# Altium schematic sheet LiFePo_Charging_Section.SchDoc
size A; DocumentNumber: 4; SheetNumber: 4; SheetTotal: 13
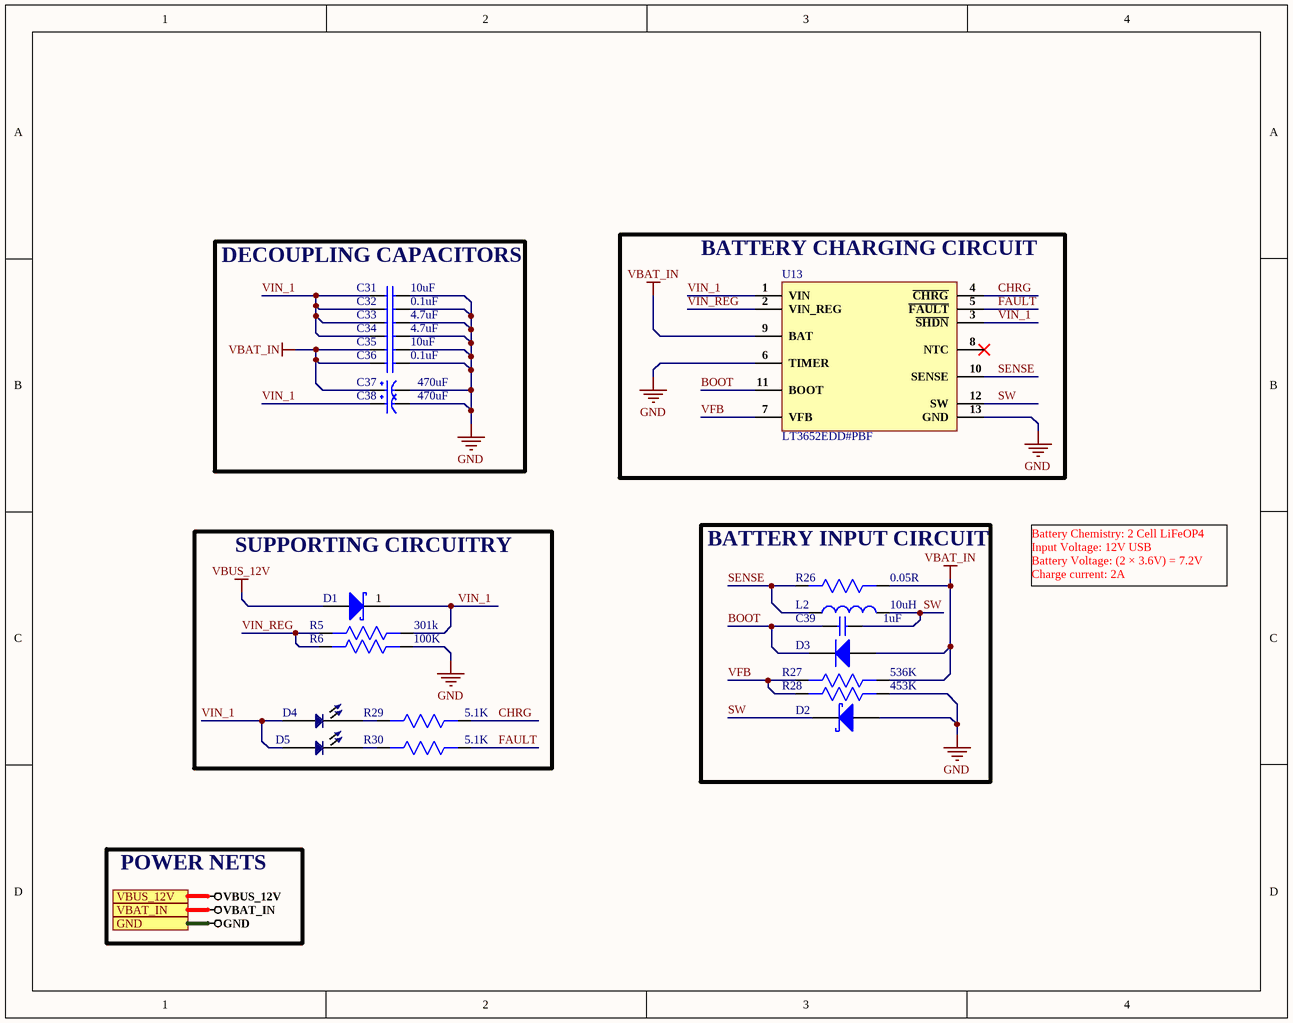
[diagram p0: LiFePo_Charging_Section.SchDoc]

## Parts
C31  10uF  [CAP-0603]
C32  0.1uF  [CAP-0603]
C33  4.7uF  [CAP-0603]
C34  4.7uF  [CAP-0603]
C35  10uF  [CAP-0603]
C36  0.1uF  [CAP-0603]
C37  470uF  [UCD1E471MNL1GS]
C38  470uF  [UCD1E471MNL1GS]
C39  1uF  [CAP-0603]
D1  CMSH3-40MA TR13 PBFREE  [DO-214AC]  (value not drawn)
D2  CMSH3-40MA TR13 PBFREE  [DO-214AC]  (value not drawn)
D3  S1A-13-F  [SMA]  (value not drawn)
D4  XZVG68W-2  [LED 0402]  (value not drawn)
D5  XZVG68W-2  [LED 0402]  (value not drawn)
L2  10uH  [SLF10145T-100M2R5-PF]
R5  301k  [RES-0603]
R6  100K  [RES-0603]
R26  0.05R  [RES 2010]
R27  536K  [RES-0603]
R28  453K  [RES-0603]
R29  5.1K  [RES-0603]
R30  5.1K  [RES-0603]
U13  LT3652EDD#PBF  [LT3652EDD#PBF]

## Blocks framed on the sheet
DECOUPLING CAPACITORS: C31-C38
BATTERY CHARGING CIRCUIT: U13
SUPPORTING CIRCUITRY: D1 D4 D5 R5 R6 R29 R30
BATTERY INPUT CIRCUIT: C39 D2 D3 L2 R26-R28

## Ports
GND, VBAT_IN, VBUS_12V

## Nets
GND: C31.2 C32.2 C33.2 C34.2 C35.2 C36.2 C37.2 C38.2 D2.2 R6.1 R28.1 U13.6(TIMER) U13.13(GND) ; port GND
VBAT_IN: C35.1 C36.1 C37.1 D3.2 R26.1 R27.1 U13.9(BAT) ; port VBAT_IN
VBUS_12V: D1.2 ; port VBUS_12V
BOOT: C39.1 D3.1 U13.11(BOOT)
CHRG: R29.1 U13.4(~{CHRG})
FAULT: R30.1 U13.5(~{FAULT})
SENSE: L2.1 R26.2 U13.10(SENSE)
SW: C39.2 D2.1 L2.2 U13.12(SW)
VFB: R27.2 R28.2 U13.7(VFB)
VIN_1: C31.1 C32.1 C33.1 C34.1 C38.1 D1.1 D4.1 D5.1 R5.1 U13.1(VIN) U13.3(~{SHDN})
VIN_REG: R5.2 R6.2 U13.2(VIN_REG)
NetD4_2: D4.2 R29.2
NetD5_2: D5.2 R30.2

Not connected (* = marked no-connect by the designer): U13 8(NTC)*

## Notes on the sheet
- Battery Chemistry: 2 Cell LiFeOP4
  Input Voltage: 12V USB
  Battery Voltage: (2 × 3.6V) = 7.2V
  Charge current: 2A
- POWER NETS

## Library data of the parts
C31 C35 = TMK107BBJ106MA-T: CAP CER 10UF 25V X5R 0603; Manufacturer: Taiyo Yuden; Tolerance: 20%; Supplier 1: Digi-Key; Manufacturer Part Number: TMK107BBJ106MA-T; Stock 1: 85333; Pricing 1: 1=0.46, 10=0.32, 50=0.2238, 100=0.1918, 500=0.14386, 1000=0.12149 (USD); Mount: Surface Mount; Case/Package: 0603; Case Code (Imperial): 0603; Case Code (Metric): 1608; Min Operating Temperature: -55°C; Max Operating Temperature: 85°C; Packaging: Tape and Reel; Capacitance: 10uF; Voltage Rating: 25V; Lead Free: Lead Free; RoHS Compliant: Yes; ComponentLink1URL: http://ds.yuden.co.jp/TYCOMPAS/ut/detail.do?productNo=TMK107BBJ106MA-T&fileName=TMK107BBJ106MA-T_SS&mode=specSheetDownload&src-supplier=Digi-Key; ComponentLink1Description: http://ds.yuden.co.jp/TYCOMPAS/ut/detail.do?productNo=TMK107BBJ106MA-T&fileName=TMK107BBJ106MA-T_SS&mode=specSheetDownload&src-supplier=Digi-Key; Supplier Part Number 1: 587-6023-1-ND
C32 C36 = CL10B104KB8NNNL: CAP CER 0.1UF 50V X7R 0603; Manufacturer: Samsung; Capacitance: 100nF; Tolerance: 10%; Supplier 1: Digi-Key; Manufacturer Part Number: CL10B104KB8NNNL; Stock 1: 3731229; Pricing 1: 1=0.1, 10=0.03, 50=0.0164, 100=0.0134, 500=0.00958, 1000=0.00753, 2500=0.00684, 5000=0.0063 (USD); Mount: Surface Mount; Case/Package: 0603; Min Operating Temperature: -55°C; Max Operating Temperature: 125°C; Dielectric: X7R; Packaging: Tape and Reel; Package Quantity: 15000; Voltage Rating: 50V; Voltage Rating (DC): 50V; Series: CL; Construction: Flat; Length: 1.6mm; Width: 0.031inch; Height: 0.8mm; Thickness: 0.035inch; Depth: 0.8mm; Radiation Hardening: No; RoHS Compliant: Yes; ComponentLink1URL: https://www.verical.com/server-webapp/html/getDatasheet?partID=357523&src-supplier=Verical; ComponentLink1Description: https://www.verical.com/server-webapp/html/getDatasheet?partID=357523&src-supplier=Verical; ComponentLink2URL: https://media.digikey.com/pdf/Data%20Sheets/Samsung%20PDFs/CL_Series_MLCC_ds.pdf?src-supplier=Digi-Key; ComponentLink2Description: https://media.digikey.com/pdf/Data%20Sheets/Samsung%20PDFs/CL_Series_MLCC_ds.pdf?src-supplier=Digi-Key; Supplier Part Number 1: 1276-CL10B104KB8NNNLCT-ND
C33 C34 = CL10A475KA8NQNC: CAP CER 4.7UF 25V X5R 0603; Manufacturer: Samsung; Tolerance: 10%; Supplier 1: Digi-Key; Manufacturer Part Number: CL10A475KA8NQNC; Stock 1: 345169; Pricing 1: 1=0.37, 10=0.255, 50=0.1784, 100=0.1528, 500=0.11462, 1000=0.0968 (USD); Mount: Surface Mount; Case/Package: 0603; Case Code (Metric): 1608; Case Code (Imperial): 0603; Contact Plating: Tin; Min Operating Temperature: -55°C; Max Operating Temperature: 85°C; Package Quantity: 1; Packaging: Tape and Reel; Capacitance: 4.7uF; Voltage Rating: 25V; Dielectric: X5R; Series: CL; Termination: Wraparound; Construction: Flat; Length: 1.6mm; Width: 0.031inch; Thickness: 0.035inch; Depth: 0.8mm; Lead Free: Lead Free; RoHS Compliant: Yes; ComponentLink1URL: http://www.samsungsem.com/kr/support/product-search/mlcc/CL10A475KA8NQNC.jsp?src-supplier=Digi-Key; ComponentLink1Description: http://www.samsungsem.com/kr/support/product-search/mlcc/CL10A475KA8NQNC.jsp?src-supplier=Digi-Key; Supplier Part Number 1: 1276-1900-6-ND
C37 C38 = UCD1E471MNL1GS: CAP ALUM 470UF 20% 25V SMD; Manufacturer: Nichicon; Ripple Current: 850mA; Impedance: 80mR; Leakage Current: 3uA; Life (Hours): 5000Hour; Dissipation Factor: 0.14%; Supplier 1: Digi-Key; Manufacturer Part Number: UCD1E471MNL1GS; Stock 1: 0; Pricing 1: 1=0.96, 10=0.708, 50=0.566, 100=0.4852 (USD); Mount: Surface Mount,PCB; Case/Package: Radial; Min Operating Temperature: -55°C; Max Operating Temperature: 105°C; Capacitance: 470uF; Tolerance: 20%; Package Quantity: 1; Packaging: Tape and Reel; Voltage Rating: 25V; Voltage Rating (DC): 25V; Termination: SMD/SMT; Voltage: 25V; Features: General Purpose; Series: CD; Construction: Cylindrical; Diameter: 10mm; Length: 10mm; Height: 10mm; Height - Seated (Max): 0.394inch; Radiation Hardening: No; RoHS Compliant: Yes; ComponentLink1URL: http://nichicon-us.com/english/products/pdfs/e-ucd.pdf?src-supplier=Digi-Key; ComponentLink1Description: http://nichicon-us.com/english/products/pdfs/e-ucd.pdf?src-supplier=Digi-Key; ComponentLink2URL: http://www.mouser.com/ds/2/293/e-cd-22158.pdf?src-supplier=Mouser; ComponentLink2Description: http://www.mouser.com/ds/2/293/e-cd-22158.pdf?src-supplier=Mouser; ComponentLink3URL: http://uk.rs-online.com/webdocs/0ebd/0900766b80ebdadd.pdf?src-supplier=RSComponents; ComponentLink3Description: http://uk.rs-online.com/webdocs/0ebd/0900766b80ebdadd.pdf?src-supplier=RSComponents; ComponentLink4URL: http://www.nichicon.co.jp/english/products/pdfs/e-cd.pdf?src-supplier=Avnet; ComponentLink4Description: http://www.nichicon.co.jp/english/products/pdfs/e-cd.pdf?src-supplier=Avnet; ComponentLink5URL: http://products.nichicon.co.jp/en/pdf/XJA043/e-cd.pdf?src-supplier=Future+Electronics; ComponentLink5Description: http://products.nichicon.co.jp/en/pdf/XJA043/e-cd.pdf?src-supplier=Future+Electronics; ComponentLink6URL: https://www.verical.com/server-webapp/html/getDatasheet?partID=512790&src-supplier=Verical; ComponentLink6Description: https://www.verical.com/server-webapp/html/getDatasheet?partID=512790&src-supplier=Verical; ComponentLink7URL: http://www.nichicon.co.jp/english/products/pdfs/e-cd.pdf?src-supplier=Avnet+Europe; ComponentLink7Description: http://www.nichicon.co.jp/english/products/pdfs/e-cd.pdf?src-supplier=Avnet+Europe; Supplier Part Number 1: 493-6386-1-ND
C39 = CL10A105KA8NNNC: CAP CER 1UF 25V X5R 0603; Manufacturer: Sams; Tolerance: 10%; Supplier 1: Digi-Key; Manufacturer Part Number: CL10A105KA8NNNC; Stock 1: 2768758; Pricing 1: 1=0.1, 10=0.036, 50=0.0198, 100=0.0161, 500=0.01152, 1000=0.00904 (USD); Mount: Surface Mount; Case/Package: 0603; Min Operating Temperature: -55°C; Max Operating Temperature: 85°C; Capacitance: 1uF; Dielectric: X5R; Voltage Rating (DC): 25V; Voltage: 25V; Length: 1.6mm; Height: 0.8mm; Depth: 0.8mm; Lead Free: Lead Free; Supplier Part Number 1: 1276-1102-1-ND
D1 D2 = CMSH3-40MA TR13 PBFREE: DIODE SCHOTTKY 40V 3A SMA; Manufacturer: Central Semiconductor; Supplier 1: Digi-Key; Manufacturer Part Number: CMSH3-40MA TR13 PBFREE; Stock 1: 27620; Pricing 1: 1=0.67, 10=0.592, 100=0.4536, 500=0.3586, 1000=0.28688, 2000=0.25999 (USD); RoHS Compliant: Yes; Supplier Part Number 1: 1514-CMSH3-40MATR13PBFREEDKR-ND
D3 = S1A-13-F: Diode Switching 50V 1A 2-Pin SMA T/R; Manufacturer: Diodes; Element Configuration: Single; Reverse Recovery Time: 3us; Peak Non-Repetitive Surge Current: 30A; Max Reverse Current: 5uA; Forward Voltage: 1.1V; Recovery Time: 1.8us; Polarity: Standard; Capacitance: 10pF; ComponentLink1URL: http://www.mouser.com/ds/2/115/ds16008-60440.pdf?src-supplier=Mouser; ComponentLink1Description: http://www.mouser.com/ds/2/115/ds16008-60440.pdf?src-supplier=Mouser; ComponentLink2URL: http://www.diodes.com///datasheets/ds16008.pdf?src-supplier=Avnet; ComponentLink2Description: http://www.diodes.com///datasheets/ds16008.pdf?src-supplier=Avnet; ComponentLink3URL: http://www.te.com/commerce/DocumentDelivery/DDEController?Action=showdoc&DocId=Data+Sheet%7FRPII%2F2%7F0415%7Fpdf%7FEnglish%7FENG_DS_RPIIX2_0415.pdf&src-supplier=Digi-Key; ComponentLink3Description: http://www.te.com/commerce/DocumentDelivery/DDEController?Action=showdoc&DocId=Data+Sheet%7FRPII%2F2%7F0415%7Fpdf%7FEnglish%7FENG_DS_RPIIX2_0415.pdf&src-supplier=Digi-Key; ComponentLink4URL: https://www.diodes.com/assets/Datasheets/ds16008.pdf?src-supplier=Digi-Key; ComponentLink4Description: https://www.diodes.com/assets/Datasheets/ds16008.pdf?src-supplier=Digi-Key; Supplier 1: Digi-Key; Manufacturer Part Number: S1A-13-F; RoHS: Yes; Category: Rectifier Diodes; Stock 1: 647079; Pricing 1: 1=0.26000, 10=0.21300, 100=0.11290, 500=0.07424, 1000=0.05049, 2000=0.04554 (USD); Mount: Surface Mount; Case/Package: SMA; Number of Pins: 2; Weight: 0.002258oz; Min Operating Temperature: -65°C; Max Operating Temperature: 150°C; Forward Current: 1A; Max Repetitive Reverse Voltage (Vrrm): 50V; Packaging: Tape and Reel; Package Quantity: 5000; Max Surge Current: 30A; Reverse Voltage (DC): 50V; Average Rectified Current: 1A; Voltage Rating (DC): 50V; Current Rating: 1A; Output Current: 1A; Max Reverse Voltage (DC): 50V; Max Forward Surge Current (Ifsm): 30A; Termination: SMD/SMT; Series: -; Length: 4.6mm; Width: 2.92mm; Height: 2.1mm; Radiation Hardening: No; Lead Free: Lead Free; REACH SVHC: No SVHC; RoHS Compliant: Yes; ComponentLink5URL: https://datasheet.ciiva.com/911/ds16003-911872.pdf?src-supplier=Digi-Key; ComponentLink5Description: https://datasheet.ciiva.com/911/ds16003-911872.pdf?src-supplier=Digi-Key; ComponentLink6URL: https://datasheet.ciiva.com/27052/1541520-27052419.pdf?src-supplier=Jameco; ComponentLink6Description: https://datasheet.ciiva.com/27052/1541520-27052419.pdf?src-supplier=Jameco; ComponentLink7URL: https://datasheet.ciiva.com/22695/1911706-22695830.pdf?src-supplier=Element14; ComponentLink7Description: https://datasheet.ciiva.com/22695/1911706-22695830.pdf?src-supplier=Element14; ComponentLink8URL: https://datasheet.ciiva.com/16199/ds16003-16199336.pdf?src-supplier=Future+Electronics; ComponentLink8Description: https://datasheet.ciiva.com/16199/ds16003-16199336.pdf?src-supplier=Future+Electronics; ComponentLink9URL: https://datasheet.ciiva.com/4453/ds16003-83672-4453580.pdf?src-supplier=Mouser; ComponentLink9Description: https://datasheet.ciiva.com/4453/ds16003-83672-4453580.pdf?src-supplier=Mouser; ComponentLink10URL: https://datasheet.ciiva.com/25953/ds16003-25953033.pdf?src-supplier=Avnet+Europe; ComponentLink10Description: https://datasheet.ciiva.com/25953/ds16003-25953033.pdf?src-supplier=Avnet+Europe; ComponentLink11URL: https://datasheet.ciiva.com/8301/ds16003-8301429.pdf?src-supplier=Avnet; ComponentLink11Description: https://datasheet.ciiva.com/8301/ds16003-8301429.pdf?src-supplier=Avnet; Supplier Part Number 1: S1A-FDICT-ND
D4 D5 = XZVG68W-2: LED GREEN CLEAR CHIP SMD; Manufacturer: SunLED; Lens Color: Colorless; Luminous Intensity: 49mcd; Test Current: 20mA; Viewing Angle: 120°; Dominant Wavelength: 570nm; Forward Voltage: 2.1V; Supplier 1: Digi-Key; Manufacturer Part Number: XZVG68W-2; Stock 1: 122154; Pricing 1: 1=0.37, 10=0.293, 100=0.1314, 500=0.11872, 1000=0.09752 (USD); Mount: Surface Mount; Case/Package: 0402; Color: Green; Case Code (Metric): 1005; Case Code (Imperial): 0402; Packaging: Tape and Reel; Lens Transparency: Clear; Length: 1mm; Width: 0.5mm; Height: 0.6mm; RoHS Compliant: Yes; ComponentLink1URL: https://www.sunledusa.com/products/spec/XZVG68W-2.pdf?src-supplier=Digi-Key; ComponentLink1Description: https://www.sunledusa.com/products/spec/XZVG68W-2.pdf?src-supplier=Digi-Key; ComponentLink2URL: http://www.sunledusa.com/products/spec/XZVG68W-2.pdf?src-supplier=Digi-Key; ComponentLink2Description: http://www.sunledusa.com/products/spec/XZVG68W-2.pdf?src-supplier=Digi-Key; Supplier Part Number 1: 1497-1219-6-ND
L2 = SLF10145T-100M2R5-PF: FIXED IND 10UH 2.5A 43.7 MOHM; Manufacturer: TDK; Core Material: Ferrite; Tolerance: 20%; Saturation Current: 3A; Shielding: Shielded; DC Resistance (DCR): 36.4mR; Test Frequency: 1kHz; Supplier 1: Digi-Key; Manufacturer Part Number: SLF10145T-100M2R5-PF; Stock 1: 3269; Pricing 1: 1=1.05, 10=0.975, 25=0.9, 50=0.75, 100=0.705, 250=0.63 (USD); Mount: Surface Mount; Case/Package: Nonstandard; Number of Pins: 2; Min Operating Temperature: -40°C; Max Operating Temperature: 105°C; Inductance: 10uH; Max DC Current: 2.5A; Package Quantity: 500; Current Rating: 2.5A; Packaging: Tape and Reel; Inductance Tolerance: 20%; Resistor Type: Wirewound; Termination: SMD/SMT; DC Current: 2.5A; RMS Current (Irms): 3A; Series: SLF; Rated Current-Max: 3A; Length: 10.1mm; Width: 0.398inch; Height: 4.5mm; Height - Seated (Max): 0.189inch; Depth: 10.4mm; Radiation Hardening: No; REACH SVHC: No SVHC; Military Standard: Not; Lead Free: Lead Free; RoHS Compliant: Yes; ComponentLink1URL: http://www.farnell.com/datasheets/1838969.pdf?src-supplier=Element14; ComponentLink1Description: http://www.farnell.com/datasheets/1838969.pdf?src-supplier=Element14; ComponentLink2URL: http://uk.rs-online.com/webdocs/14e9/0900766b814e91a9.pdf?src-supplier=RSComponents; ComponentLink2Description: http://uk.rs-online.com/webdocs/14e9/0900766b814e91a9.pdf?src-supplier=RSComponents; ComponentLink3URL: http://components.arrow.com/part/dataview/42010891S8914805N1165?src-supplier=Arrow+Electronics; ComponentLink3Description: http://components.arrow.com/part/dataview/42010891S8914805N1165?src-supplier=Arrow+Electronics; ComponentLink4URL: http://datasheet.iiic.cc/tdk/SLF10145T-100M2R5-PF.pdf?src-supplier=IIIC; ComponentLink4Description: http://datasheet.iiic.cc/tdk/SLF10145T-100M2R5-PF.pdf?src-supplier=IIIC; Supplier Part Number 1: 445-1975-6-ND
R5 = CRCW0603301KFKEB: RES SMD 301K OHM 1% 1/10W 0603; Manufacturer: Vishay Dale; Resistance: 301kR; Power Rating: 100mW; Voltage Rating: 75V; Temperature Coefficient: 100ppm/°C; Supplier 1: Digi-Key; Manufacturer Part Number: CRCW0603301KFKEB; Stock 1: 17460; Pricing 1: 1=0.1, 10=0.036, 100=0.0145, 1000=0.00652, 2500=0.00566, 5000=0.00468 (USD); Case/Package: 0603; Weight: 7.1E-05oz; Case Code (Imperial): 0603; Case Code (Metric): 1608; Min Operating Temperature: -55°C; Max Operating Temperature: 155°C; Tolerance: 1%; Packaging: Tape and Reel; Package Quantity: 10000; Resistor Type: Thick Film; Termination: SMD/SMT; Number of Terminations: 2; Max Power Dissipation: 100mW; Features: Automotive AEC-Q200; Series: CRCW; Construction: Rectangular; Length: 1.55mm; Width: 0.85mm; Height: 0.02inch; Depth: 0.85mm; Military Standard: Not; Lead Free: Lead Free; RoHS Compliant: Yes; ComponentLink1URL: http://www.mouser.com/ds/2/427/dcrcwe3-109170.pdf?src-supplier=Mouser; ComponentLink1Description: http://www.mouser.com/ds/2/427/dcrcwe3-109170.pdf?src-supplier=Mouser; ComponentLink2URL: http://components.arrow.com/part/dataview/0323_06076993?src-supplier=Arrow+Europe; ComponentLink2Description: http://components.arrow.com/part/dataview/0323_06076993?src-supplier=Arrow+Europe; ComponentLink3URL: http://www.vishay.com/docs/20035/dcrcwe3.pdf?src-supplier=Digi-Key; ComponentLink3Description: http://www.vishay.com/docs/20035/dcrcwe3.pdf?src-supplier=Digi-Key; Supplier Part Number 1: 541-CRCW0603301KFKEBDKR-ND
R6 = CRGH0603J100K: RES SMD 100K OHM 5% 1/5W 0603; Manufacturer: TE Connectivity; Resistance: 100kR; Temperature Coefficient: 100ppm/°C; Power Rating: 200mW; Voltage Rating: 50V; Number of Resistors: 1; Supplier 1: Digi-Key; Manufacturer Part Number: CRGH0603J100K; Stock 1: 23277; Pricing 1: 1=0.1, 10=0.049, 100=0.02, 1000=0.00899, 2500=0.0078 (USD); Mount: Surface Mount; Case/Package: 0603; Case Code (Imperial): 0603; Case Code (Metric): 1608; Min Operating Temperature: -55°C; Max Operating Temperature: 125°C; Tolerance: 5%; Packaging: Tape and Reel; Resistor Type: Thick Film,Power resistor; Number of Terminations: 2; Series: CRGH; Termination: Solder; Voltage Rating (DC): 50V; Resistance Tolerance: 5%; Technology: THICK FILM; Length: 1.6mm; Width: 0.8mm; Height: 0.45mm; Depth: 0.8mm; RoHS Compliant: Yes; REACH SVHC: No SVHC; ELV: Compliant; ComponentLink1URL: http://www.farnell.com/datasheets/2007183.pdf?src-supplier=Element14; ComponentLink1Description: http://www.farnell.com/datasheets/2007183.pdf?src-supplier=Element14; Supplier Part Number 1: A126393DKR-ND
R26 = WSL2010R0500FEA: RES 0.05 OHM 1% 1/2W 2010; Manufacturer: Vishay Dale; Temperature Coefficient: 75ppm/°C; Resistance: 50mR; Power Rating: 500mW; Voltage Rating: 150mV; Supplier 1: Digi-Key; Manufacturer Part Number: WSL2010R0500FEA; RoHS: No; Category: Chip SMD Resistors; Stock 1: 20000; Pricing 1: 1=0.92000, 10=0.81400, 25=0.74800, 50=0.68240, 100=0.59060, 250=0.49876, 500=0.42000, 1000=0.35000 (USD); Mount: Surface Mount; Case/Package: 2010; Number of Pins: 2; Contact Plating: Tin,Matte; Weight: 0.001372oz; Case Code (Metric): 5025; Case Code (Imperial): 2010; Min Operating Temperature: -65°C; Max Operating Temperature: 170°C; Resistor Type: Metal Element,Metal Strip; Tolerance: 1%; Features: Moisture Resistant; Number of Terminations: 2; Termination: SMD/SMT; Max Power Dissipation: 500mW; Package Quantity: 1; Packaging: Tape and Reel; Length: 5.08mm; Width: 0.1inch; Height: 0.635mm; Depth: 2.54mm; Radiation Hardening: No; REACH SVHC: No SVHC; Military Standard: Not; Lead Free: Lead Free; ComponentLink1URL: https://datasheet.ciiva.com/2483/wsl-2483729.pdf?src-supplier=Digi-Key; ComponentLink1Description: https://datasheet.ciiva.com/2483/wsl-2483729.pdf?src-supplier=Digi-Key; ComponentLink2URL: https://datasheet.ciiva.com/2483/wsl-2483730.pdf?src-supplier=Digi-Key; ComponentLink2Description: https://datasheet.ciiva.com/2483/wsl-2483730.pdf?src-supplier=Digi-Key; ComponentLink3URL: https://datasheet.ciiva.com/2483/wsl-2483731.pdf?src-supplier=Digi-Key; ComponentLink3Description: https://datasheet.ciiva.com/2483/wsl-2483731.pdf?src-supplier=Digi-Key; ComponentLink4URL: https://datasheet.ciiva.com/7695/wsl-7695158.pdf?src-supplier=Element14; ComponentLink4Description: https://datasheet.ciiva.com/7695/wsl-7695158.pdf?src-supplier=Element14; ComponentLink5URL: https://datasheet.ciiva.com/16215/wsl-16215947.pdf?src-supplier=Future+Electronics; ComponentLink5Description: https://datasheet.ciiva.com/16215/wsl-16215947.pdf?src-supplier=Future+Electronics; ComponentLink6URL: https://datasheet.ciiva.com/17177/wsl-17177243.pdf?src-supplier=Avnet+Europe; ComponentLink6Description: https://datasheet.ciiva.com/17177/wsl-17177243.pdf?src-supplier=Avnet+Europe; ComponentLink7URL: https://datasheet.ciiva.com/28621/1911169-28621837.pdf?src-supplier=Element14; ComponentLink7Description: https://datasheet.ciiva.com/28621/1911169-28621837.pdf?src-supplier=Element14; ComponentLink8URL: https://datasheet.ciiva.com/36857/442550-36857725.pdf?src-supplier=Element14; ComponentLink8Description: https://datasheet.ciiva.com/36857/442550-36857725.pdf?src-supplier=Element14; Supplier Part Number 1: WSLE-.05CT-ND
R27 = CRCW0603536KFKEA: RES SMD 536K OHM 1% 1/10W 0603; Manufacturer: Vishay; Resistance: 536kR; Max Power Dissipation: 100mW; Temperature Coefficient: 100ppm/°C; Voltage Rating: 75V; Supplier 1: Digi-Key; Manufacturer Part Number: CRCW0603536KFKEA; Stock 1: 9555; Pricing 1: 1=0.1, 10=0.036, 100=0.0145, 1000=0.00652, 2500=0.00566 (USD); Case/Package: 0603; Number of Pins: 2; Weight: 7.1E-05oz; Case Code (Metric): 1608; Case Code (Imperial): 0603; Contact Plating: Tin; Size Code: 0603; Min Operating Temperature: -55°C; Max Operating Temperature: 155°C; Packaging: Tape and Reel; Tolerance: 1%; Package Quantity: 10; Resistor Type: Thick Film; Number of Terminations: 2; Features: Automotive AEC-Q200; Series: CRCW; Power Rating: 100mW; Termination: SMD/SMT; Voltage Rating (DC): 75V; Construction: Rectangular; Technology: THICK FILM; Resistance Tolerance: 1%; Length: 1.55mm; Width: 0.033inch; Height: 0.45mm; Depth: 0.85mm; Radiation Hardening: No; Lead Free: Lead Free; RoHS Compliant: Yes; REACH SVHC: Unknown; Military Standard: Not; ComponentLink1URL: http://www.farnell.com/datasheets/1697337.pdf?src-supplier=Element14; ComponentLink1Description: http://www.farnell.com/datasheets/1697337.pdf?src-supplier=Element14; ComponentLink2URL: http://www.farnell.com/datasheets/2111203.pdf?src-supplier=Element14; ComponentLink2Description: http://www.farnell.com/datasheets/2111203.pdf?src-supplier=Element14; ComponentLink3URL: http://www.vishay.com/docs/20035/dcrcwe3.pdf?src-supplier=Digi-Key; ComponentLink3Description: http://www.vishay.com/docs/20035/dcrcwe3.pdf?src-supplier=Digi-Key; ComponentLink4URL: http://www.mouser.com/ds/2/427/dcrcwe3-109170.pdf?src-supplier=Mouser; ComponentLink4Description: http://www.mouser.com/ds/2/427/dcrcwe3-109170.pdf?src-supplier=Mouser; ComponentLink5URL: http://www.vishay.com/docs/20035/dcrcwe3.pdf?src-supplier=Future+Electronics; ComponentLink5Description: http://www.vishay.com/docs/20035/dcrcwe3.pdf?src-supplier=Future+Electronics; Supplier Part Number 1: 541-536KHCT-ND
R28 = RC0603FR-07453KL: Res Thick Film 0603 453K Ohm 1% 1/10W ±100ppm/°C Molded SMD Paper T/R; Manufacturer: Yageo; Resistance: 453kR; Power Rating: 100mW; Voltage Rating: 50V; Supplier 1: Arrow Electronics; Manufacturer Part Number: RC0603FR-07453KL; RoHS: Yes; Category: Chip SMD Resistors; Stock 1: 507; Pricing 1: 1=0.03580, 10=0.01600, 25=0.01590, 100=0.00730, 500=0.00670 (USD); Case/Package: 0603; Contact Plating: Tin,Matte; Case Code (Imperial): 0603; Case Code (Metric): 1608; Size Code: 0603; Min Operating Temperature: -55°C; Max Operating Temperature: 155°C; Tolerance: 1%; Resistor Type: Thick Film; Temperature Coefficient: 100ppm/°C; Packaging: Tape and Reel; Termination: SMD/SMT; Voltage Rating (DC): 50V; Features: Moisture Resistant; Series: RC; Max Power Dissipation: 100mW; Number of Terminations: 2; Construction: Rectangular; Length: 1.6mm; Width: 0.8mm; Height: 0.45mm; Depth: 0.8mm; Military Standard: Not; Lead Free: Lead Free; RoHS Compliant: Yes; ComponentLink1URL: https://datasheet.ciiva.com/28390/pyu-rc0603-51-rohs-l-4-28390650.pdf?src-supplier=Avnet+Europe; ComponentLink1Description: https://datasheet.ciiva.com/28390/pyu-rc0603-51-rohs-l-4-28390650.pdf?src-supplier=Avnet+Europe; ComponentLink2URL: https://datasheet.ciiva.com/8885/pyu-rc0603-51-rohs-l-4-8885677.pdf?src-supplier=Avnet; ComponentLink2Description: https://datasheet.ciiva.com/8885/pyu-rc0603-51-rohs-l-4-8885677.pdf?src-supplier=Avnet; Supplier Part Number 1: RC0603FR-07453KL
R29 R30 = RMCF0603FT5K10: RES 5.1K OHM 1% 1/10W 0603; Manufacturer: Stackpole Electronics; Resistance: 5.1kR; Max Power Dissipation: 100mW; Temperature Coefficient: 100ppm/°C; Supplier 1: Digi-Key; Manufacturer Part Number: RMCF0603FT5K10; Stock 1: 164423; Pricing 1: 1=0.1, 10=0.017, 100=0.0068, 1000=0.00305, 2500=0.00264 (USD); Mount: Surface Mount; Case/Package: 0603; Case Code (Metric): 1608; Case Code (Imperial): 0603; Contact Plating: Tin,Matte; Min Operating Temperature: -55°C; Max Operating Temperature: 155°C; Tolerance: 1%; Packaging: Tape and Reel; Resistor Type: Thick Film; Number of Terminations: 2; Features: Automotive AEC-Q200; Series: RMCF; Length: 0.061inch; Width: 0.031inch; Height: 0.022inch; Radiation Hardening: No; RoHS Compliant: Yes; ComponentLink1URL: https://www.seielect.com/catalog/SEI-RMCF_RMCP.pdf?src-supplier=Avnet; ComponentLink1Description: https://www.seielect.com/catalog/SEI-RMCF_RMCP.pdf?src-supplier=Avnet; ComponentLink2URL: http://components.arrow.com/part/dataview/50863347S9465827N1174?src-supplier=Arrow+Electronics; ComponentLink2Description: http://components.arrow.com/part/dataview/50863347S9465827N1174?src-supplier=Arrow+Electronics; ComponentLink3URL: https://www.seielect.com/catalog/SEI-Packaging.pdf?src-supplier=Digi-Key; ComponentLink3Description: https://www.seielect.com/catalog/SEI-Packaging.pdf?src-supplier=Digi-Key; Supplier Part Number 1: RMCF0603FT5K10DKR-ND
U13 = LT3652EDD#PBF: Battery Charger Li-Ion 2000mA 4.2V Automotive 12-Pin DFN EP; Manufacturer: Analog Devices / Linear Technology; Max Supply Voltage: 32V; Min Supply Voltage: 4.95V; Output Current: 2mA; Max Output Current: 2A; ComponentLink1URL: http://www.mouser.com/ds/2/445/7447779122-538892.pdf?src-supplier=Mouser; ComponentLink1Description: http://www.mouser.com/ds/2/445/7447779122-538892.pdf?src-supplier=Mouser; ComponentLink2URL: http://katalog.we-online.de/pbs/datasheet/7447779122.pdf?src-supplier=Digi-Key; ComponentLink2Description: http://katalog.we-online.de/pbs/datasheet/7447779122.pdf?src-supplier=Digi-Key; Supplier 1: Digi-Key; Manufacturer Part Number: LT3652EDD#PBF; RoHS: Yes; Category: Battery Management; Stock 1: 1554; Pricing 1: 1=7.32000, 10=6.60900, 25=6.30160, 100=5.47170, 250=5.22580, 500=4.76470, 1000=4.35000 (USD); Mount: Surface Mount; Case/Package: DFN; Number of Pins: 12; Min Operating Temperature: -40°C; Max Operating Temperature: 125°C; Package Quantity: 121; Packaging: Rail/Tube; Series: -; Output Voltage: 4.2V; Max Output Voltage: 4.2V; Max Charge Current: 2A; Length: 3mm; Width: 3mm; Height: 0.7mm; Radiation Hardening: No; REACH SVHC: No SVHC; RoHS Compliant: Yes; ComponentLink3URL: https://datasheet.ciiva.com/1138/1692510-1138257.pdf?src-supplier=Element14; ComponentLink3Description: https://datasheet.ciiva.com/1138/1692510-1138257.pdf?src-supplier=Element14; ComponentLink4URL: https://datasheet.ciiva.com/14093/lt3652-eng-ds-14093922.pdf?src-supplier=Distrelec; ComponentLink4Description: https://datasheet.ciiva.com/14093/lt3652-eng-ds-14093922.pdf?src-supplier=Distrelec; ComponentLink5URL: https://datasheet.ciiva.com/15114/getdatasheetpartid-368876-15114676.pdf?src-supplier=Verical; ComponentLink5Description: https://datasheet.ciiva.com/15114/getdatasheetpartid-368876-15114676.pdf?src-supplier=Verical; ComponentLink6URL: https://datasheet.ciiva.com/30477/0900766b812525a8-30477820.pdf?src-supplier=RSComponents; ComponentLink6Description: https://datasheet.ciiva.com/30477/0900766b812525a8-30477820.pdf?src-supplier=RSComponents; ComponentLink7URL: https://datasheet.ciiva.com/1144/3652fd-1144158.pdf?src-supplier=Newark; ComponentLink7Description: https://datasheet.ciiva.com/1144/3652fd-1144158.pdf?src-supplier=Newark; ComponentLink8URL: https://datasheet.ciiva.com/26874/lt3652edd-pbf-26874578.pdf?src-supplier=IIIC; ComponentLink8Description: https://datasheet.ciiva.com/26874/lt3652edd-pbf-26874578.pdf?src-supplier=IIIC; ComponentLink9URL: https://datasheet.ciiva.com/1496/1692510-1496793.pdf?src-supplier=Farnell; ComponentLink9Description: https://datasheet.ciiva.com/1496/1692510-1496793.pdf?src-supplier=Farnell; ComponentLink10URL: https://datasheet.ciiva.com/22642/1684150-22642988.pdf?src-supplier=Element14; ComponentLink10Description: https://datasheet.ciiva.com/22642/1684150-22642988.pdf?src-supplier=Element14; ComponentLink11URL: https://datasheet.ciiva.com/22647/1692510-22647788.pdf?src-supplier=Farnell; ComponentLink11Description: https://datasheet.ciiva.com/22647/1692510-22647788.pdf?src-supplier=Farnell; ComponentLink12URL: https://datasheet.ciiva.com/1932/28522-1932094.pdf?src-supplier=Digi-Key; ComponentLink12Description: https://datasheet.ciiva.com/1932/28522-1932094.pdf?src-supplier=Digi-Key; Supplier Part Number 1: LT3652EDD#PBF-ND